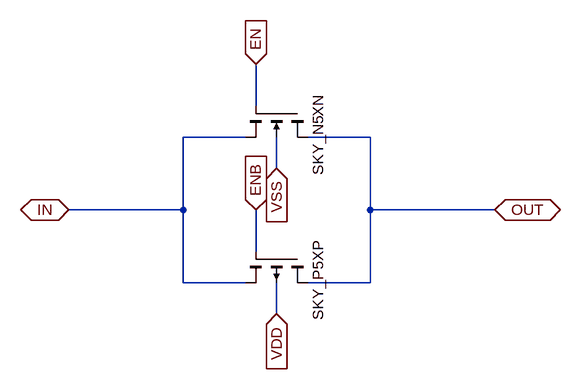
[diagram p0: schematic CMOS_TG.asc]
CMOS_TG.asc, the LTspice schematic file:
Version 4.1
SHEET 1 960 704
WIRE 304 192 400 192
WIRE 496 192 592 192
WIRE 416 144 416 80
WIRE 448 192 448 240
WIRE 304 416 400 416
WIRE 496 416 592 416
WIRE 416 368 416 304
WIRE 448 416 448 464
WIRE 304 192 304 304
WIRE 304 304 304 416
WIRE 128 304 304 304
WIRE 592 192 592 304
WIRE 592 304 592 416
WIRE 592 304 784 304
FLAG 416 80 EN
IOPIN 416 80 In
FLAG 448 240 VSS
IOPIN 448 240 In
FLAG 416 304 ENB
IOPIN 416 304 In
FLAG 448 464 VDD
IOPIN 448 464 In
FLAG 128 304 IN
IOPIN 128 304 BiDir
FLAG 784 304 OUT
IOPIN 784 304 BiDir
SYMBOL nmos4 496 144 R90
WINDOW 0 -16 -16 Left 2
WINDOW 3 16 -16 Left 2
SYMATTR InstName XN
SYMATTR Value SKY_N5
SYMATTR SpiceLine w=7 l=0.5 mult=4
SYMATTR Prefix X
SYMBOL pmos4 496 368 R90
WINDOW 0 -16 -16 Left 2
WINDOW 3 16 -16 Left 2
SYMATTR InstName XP
SYMATTR Value SKY_P5
SYMATTR SpiceLine w=7 l=0.5 mult=8
SYMATTR Prefix X

The netlist it stands for:
* CMOS_TG.asc
X§XN OUT EN IN VSS SKY_N5 w=7 l=0.5 mult=4  ; pins D G S B
X§XP OUT ENB IN VDD SKY_P5 w=7 l=0.5 mult=8  ; pins D G S B
.backanno
.end